# Altium schematic sheet ADL S PCH 600 SPI_PM.schdoc
size 420 x 298 mm; Symbol: Sheet-Symbol_A3; Company: 嘉立创EDA; Version: V1.0; Page Size: A3; @Project Name: 【全网首发】X86电脑主板_copy; @Page Count: 9; @Update Date: 2025-10-09; @Create Date: 2025-10-09; @Schematic Name: SCHEMATIC1_1; @Page No: 0; @Page Name: ADL S PCH 600 SPI/PM; Device: Sheet-Symbol_A3
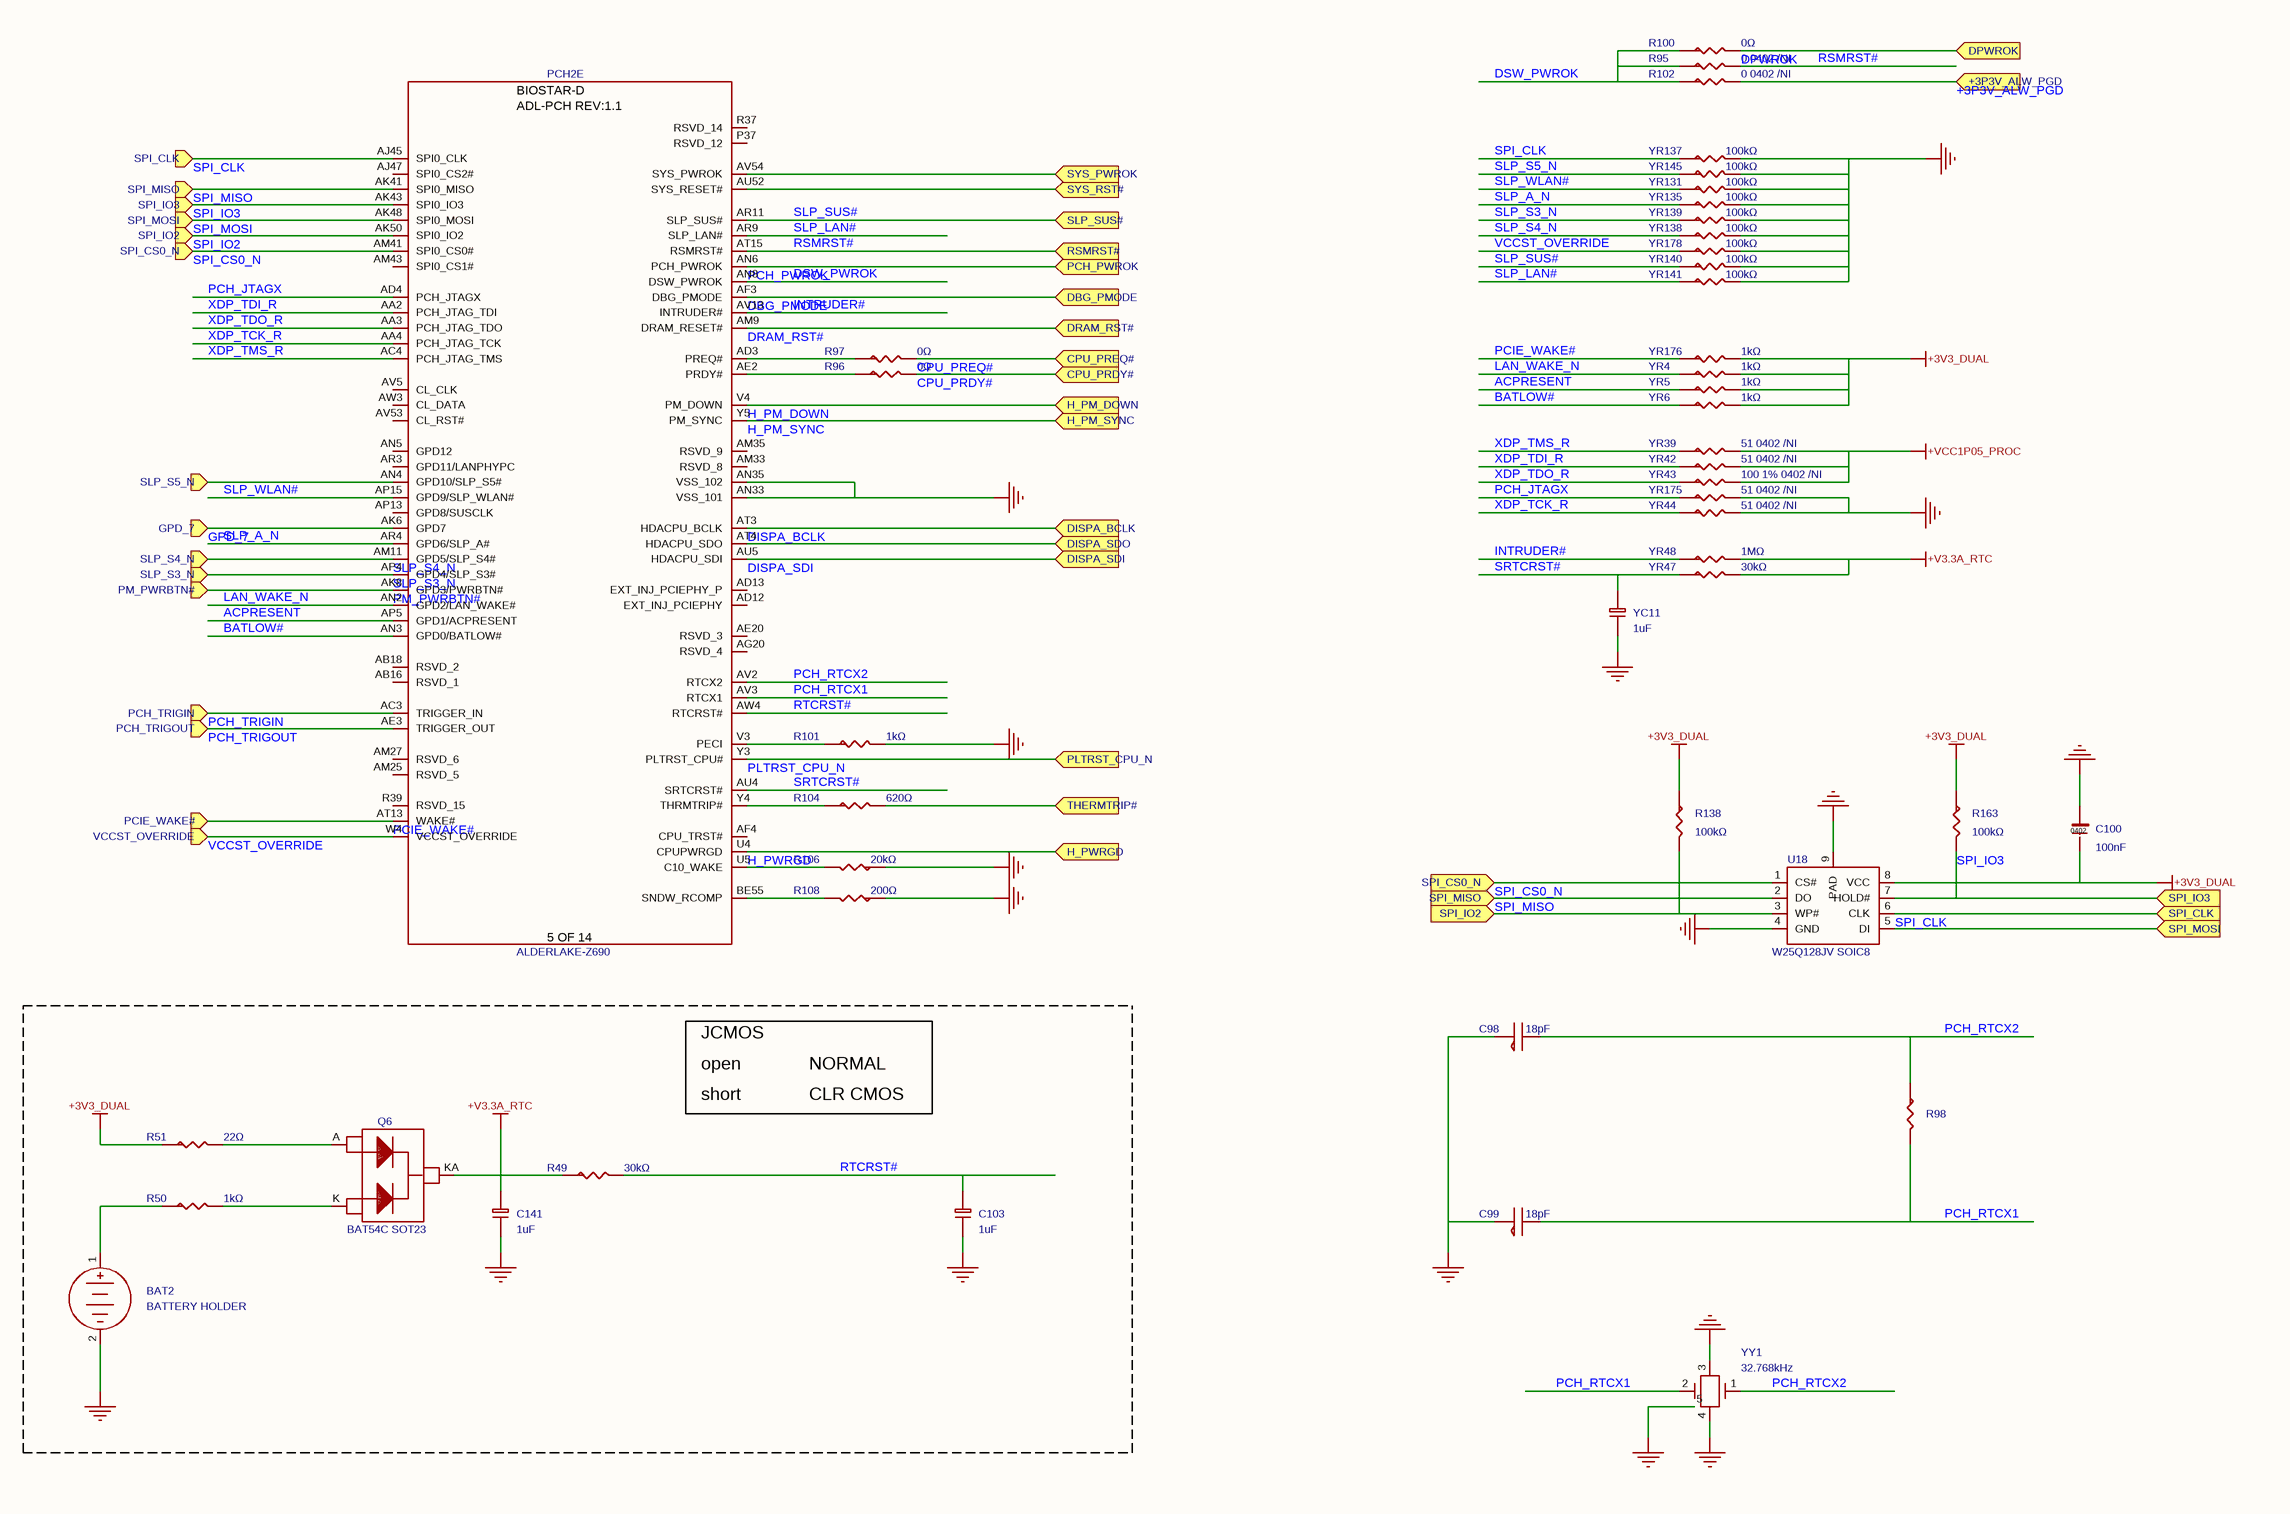
[diagram p0: ADL S PCH 600 SPI_PM.schdoc]

## Parts
BAT2  value BATTERY HOLDER  [BAT]  (hidden comment: BS-02-A1AJ010)
C98  18pF  [C0402_2]
C99  18pF  [C0402]
C100  100nF  [C0402_3]
C103  1uF  [C0402_2]
C141  1uF  [C0402_3]
PCH2  value ALDERLAKE-Z690  [BGA1045_28X25MM-ADL]  (hidden comment: ADL_S_PCH_EXT_4)  (part E of 14)
Q6  value BAT54C SOT23  [SOT23-AKAK]  (hidden comment: BAT54C)
R49  30kΩ  [R0402_2]
R50  1kΩ  [R0402]
R51  22Ω  [R0402_2]
R95  value 0 0402 /NI  [R0402_2]  (hidden comment: 42A**-F)
R96  0Ω  [R0402]
R97  0Ω  [R0402_1]
R98  0402WGF1005TCE  [R0402_2]  (value not drawn)
R100  0Ω  [R0402]
R101  1kΩ  [R0402_1]
R102  value 0 0402 /NI  [R0402_3]  (hidden comment: 42A**-F)
R104  620Ω  [R0402]
R106  20kΩ  [R0402_2]
R108  200Ω  [R0402_1]
R138  100kΩ  [R0402_1]
R163  100kΩ  [R0402]
U18  value W25Q128JV SOIC8  [WSON8-8X6MM-9P]  (hidden comment: W25Q128JVSIQ)
YC11  1uF  [C0402_2]
YR4  1kΩ  [R0402_1]
YR5  1kΩ  [R0402_1]
YR6  1kΩ  [R0402_1]
YR39  value 51 0402 /NI  [R0402]  (hidden comment: R-0603)
YR42  value 51 0402 /NI  [R0402]  (hidden comment: R-0603)
YR43  value 100 1% 0402 /NI  [R0402]  (hidden comment: R-0603)
YR44  value 51 0402 /NI  [R0402]  (hidden comment: R-0603)
YR47  30kΩ  [R0402]
YR48  1MΩ  [R0402]
YR131  100kΩ  [R0402]
YR135  100kΩ  [R0402]
YR137  100kΩ  [R0402_3]
YR138  100kΩ  [R0402_2]
YR139  100kΩ  [R0402]
YR140  100kΩ  [R0402_2]
YR141  100kΩ  [R0402_2]
YR145  100kΩ  [R0402]
YR175  value 51 0402 /NI  [R0402]  (hidden comment: R-0603)
YR176  1kΩ  [R0402_1]
YR178  100kΩ  [R0402]
YY1  32.768kHz  [XTAL_CYLINDER_DH]

## Ports
+3P3V_ALW_PGD (in), CPU_PRDY# (in), CPU_PREQ# (in), DBG_PMODE (in), DISPA_BCLK (in), DISPA_SDI (in), DISPA_SDO (in), DPWROK (in), DRAM_RST# (in), GPD_7 (in), H_PM_DOWN (in), H_PM_SYNC (in), H_PWRGD (in), PCH_PWROK (in), PCH_TRIGIN (in), PCH_TRIGOUT (in), PCIE_WAKE# (in), PLTRST_CPU_N (in), PM_PWRBTN# (in), RSMRST# (in), SLP_S3_N (in), SLP_S4_N (in), SLP_S5_N (in), SLP_SUS# (in), SPI_CLK (in), SPI_CS0_N (in), SPI_IO2 (in), SPI_IO3 (in), SPI_MISO (in), SPI_MOSI (in), SYS_PWROK (in), SYS_RST# (in), THERMTRIP# (in), VCCST_OVERRIDE (in)

## Nets
+3V3_DUAL: C100.2 R51.1 R138.1 R163.1 U18.8(VCC) YR4.2 YR5.2 YR6.2 YR176.2
+V3.3A_RTC: C141.1 Q6.KA R49.1 YR47.2 YR48.2
+VCC1P05_PROC: YR39.2 YR42.2 YR43.2
GND: BAT2.2(-) C98.1 C99.1 C100.1 C103.2 C141.2 PCH2.AN33(VSS_101) PCH2.AN35(VSS_102) R101.2 R106.1 R108.1 U18.4(GND) U18.9(PAD) YC11.2 YR44.2 YR131.2 YR135.2 YR137.2 YR138.2 YR139.2 YR140.2 YR141.2 YR145.2 YR175.2 YR178.2 YY1.3 YY1.4 YY1.5
+3P3V_ALW_PGD: R102.2 ; port +3P3V_ALW_PGD
ACPRESENT: PCH2.AP5(GPD1/ACPRESENT) YR5.1
BATLOW#: PCH2.AN3(GPD0/BATLOW#) YR6.1
CPU_PRDY#: R96.2 ; port CPU_PRDY#
CPU_PREQ#: R97.2 ; port CPU_PREQ#
DBG_PMODE: PCH2.AF3(DBG_PMODE) ; port DBG_PMODE
DISPA_BCLK: PCH2.AT3(HDACPU_BCLK) ; port DISPA_BCLK
DISPA_SDI: PCH2.AU5(HDACPU_SDI) ; port DISPA_SDI
DISPA_SDO: PCH2.AT4(HDACPU_SDO) ; port DISPA_SDO
DPWROK: R100.2 ; port DPWROK
DRAM_RST#: PCH2.AM9(DRAM_RESET#) ; port DRAM_RST#
DSW_PWROK: PCH2.AN8(DSW_PWROK) R95.1 R100.1 R102.1
GPD_7: PCH2.AK6(GPD7) ; port GPD_7
H_PM_DOWN: PCH2.V4(PM_DOWN) ; port H_PM_DOWN
H_PM_SYNC: PCH2.Y5(PM_SYNC) ; port H_PM_SYNC
H_PWRGD: PCH2.U4(CPUPWRGD) ; port H_PWRGD
INTRUDER#: PCH2.AV13(INTRUDER#) YR48.1
LAN_WAKE_N: PCH2.AN2(GPD2/LAN_WAKE#) YR4.1
PCH_JTAGX: PCH2.AD4(PCH_JTAGX) YR175.1
PCH_PWROK: PCH2.AN6(PCH_PWROK) ; port PCH_PWROK
PCH_RTCX1: C99.2 PCH2.AV3(RTCX1) R98.2 YY1.2
PCH_RTCX2: C98.2 PCH2.AV2(RTCX2) R98.1 YY1.1
PCH_TRIGIN: PCH2.AC3(TRIGGER_IN) ; port PCH_TRIGIN
PCH_TRIGOUT: PCH2.AE3(TRIGGER_OUT) ; port PCH_TRIGOUT
PCIE_WAKE#: PCH2.AT13(WAKE#) YR176.1 ; port PCIE_WAKE#
PLTRST_CPU_N: PCH2.Y3(PLTRST_CPU#) ; port PLTRST_CPU_N
PM_PWRBTN#: PCH2.AK8(GPD3/PWRBTN#) ; port PM_PWRBTN#
RSMRST#: PCH2.AT15(RSMRST#) R95.2 ; port RSMRST#
RTCRST#: C103.1 PCH2.AW4(RTCRST#) R49.2
SLP_A_N: PCH2.AR4(GPD6/SLP_A#) YR135.1
SLP_LAN#: PCH2.AR9(SLP_LAN#) YR141.1
SLP_S3_N: PCH2.AP4(GPD4/SLP_S3#) YR139.1 ; port SLP_S3_N
SLP_S4_N: PCH2.AM11(GPD5/SLP_S4#) YR138.1 ; port SLP_S4_N
SLP_S5_N: PCH2.AN4(GPD10/SLP_S5#) ; port SLP_S5_N
SLP_S5_N: YR145.1  [a separate net that carries the same name]
SLP_SUS#: PCH2.AR11(SLP_SUS#) YR140.1 ; port SLP_SUS#
SLP_WLAN#: PCH2.AP15(GPD9/SLP_WLAN#) YR131.1
SPI_CLK: PCH2.AJ45(SPI0_CLK) U18.6(CLK) YR137.1 ; port SPI_CLK
SPI_CS0_N: PCH2.AM41(SPI0_CS0#) U18.1(CS#) ; port SPI_CS0_N
SPI_IO2: PCH2.AK50(SPI0_IO2) R138.2 U18.3(WP#) ; port SPI_IO2
SPI_IO3: PCH2.AK43(SPI0_IO3) R163.2 U18.7(HOLD#) ; port SPI_IO3
SPI_MISO: PCH2.AK41(SPI0_MISO) U18.2(DO) ; port SPI_MISO
SPI_MOSI: PCH2.AK48(SPI0_MOSI) U18.5(DI) ; port SPI_MOSI
SRTCRST#: PCH2.AU4(SRTCRST#) YC11.1 YR47.1
SYS_PWROK: PCH2.AV54(SYS_PWROK) ; port SYS_PWROK
SYS_RST#: PCH2.AU52(SYS_RESET#) ; port SYS_RST#
THERMTRIP#: R104.2 ; port THERMTRIP#
VCCST_OVERRIDE: PCH2.W4(VCCST_OVERRIDE) YR178.1 ; port VCCST_OVERRIDE
XDP_TCK_R: PCH2.AA4(PCH_JTAG_TCK) YR44.1
XDP_TDI_R: PCH2.AA2(PCH_JTAG_TDI) YR42.1
XDP_TDO_R: PCH2.AA3(PCH_JTAG_TDO) YR43.1
XDP_TMS_R: PCH2.AC4(PCH_JTAG_TMS) YR39.1
NetBAT2_1: BAT2.1(+) R50.1
NetPCH2_AD3: PCH2.AD3(PREQ#) R97.1
NetPCH2_AE2: PCH2.AE2(PRDY#) R96.1
NetPCH2_BE55: PCH2.BE55(SNDW_RCOMP) R108.2
NetPCH2_U5: PCH2.U5(C10_WAKE) R106.2
NetPCH2_V3: PCH2.V3(PECI) R101.1
NetPCH2_Y4: PCH2.Y4(THRMTRIP#) R104.1
NetQ6_A: Q6.A R51.2
NetQ6_K: Q6.K R50.2

Not connected (* = marked no-connect by the designer): PCH2 AB16(RSVD_1) AB18(RSVD_2) AD12(EXT_INJ_PCIEPHY) AD13(EXT_INJ_PCIEPHY_P) AE20(RSVD_3) AF4(CPU_TRST#) AG20(RSVD_4) AJ47(SPI0_CS2#) AM25(RSVD_5) AM27(RSVD_6) AM33(RSVD_8) AM35(RSVD_9) AM43(SPI0_CS1#) AN5(GPD12) AP13(GPD8/SUSCLK) AR3(GPD11/LANPHYPC) AV5(CL_CLK) AV53(CL_RST#) AW3(CL_DATA) P37(RSVD_12) R37(RSVD_14) R39(RSVD_15)

## Notes on the sheet
- JCMOS
- short
- open
- CLR CMOS
- NORMAL
- 更新日期
- 2025-10-09
- 原理图
- 图页
- SCHEMATIC1_1
- ADL S PCH 600 SPI/PM
- 创建日期
- 物料编码
- 审阅
- 绘制
- 【全网首发】X86电脑主板_copy
- 版本
- V1.0
- 尺寸
- A3
- 页
- 0
- 嘉立创EDA
- 共
- 9
- (in symbol ADL_S_PCH_EXT_4, part E) BIOSTAR-D; ADL-PCH REV:1.1; 5 OF 14

## Library data of the parts
BAT2 = BS-02-A1AJ010: 连接器类型:电池底座;适用电池规格:CR2032;工作温度范围:-25℃~+85℃;; Manufacturer: MYOUNG(美阳); Symbol: BATTERY_2; AddInBom: yes; ModelId: 45816e8fa50b4d3ea70b2401b82a928f; ModelName: BAT-TH_BS-02-A1AJ010; ModelTransform: 963.726,869.93873,0,0,0,0,-33.504,0,-118.11; Connector Type: 电池底座; Battery Type: CR2032; Device: BS-02-A1AJ010; LCSC Part Name: 电池底座 适用电池:CR2032; SupplierPart: C5239862; ManufacturerPart: BS-02-A1AJ010; Supplier Footprint: 插件; JLCPCB Part Class: Extended Part; Datasheet: https://atta.szlcsc.com/upload/public/pdf/source/20221102/8F00F2B23A2A3C447A59C327BBA6C743.pdf; Supplier: LCSC; ConvertToPcb: yes; FootprintName: BAT; Operating Temperature Range: -25℃~+85℃
C98 C99 = CC0402FRNPO9BN180: 容值:18pF;精度:±1%;额定电压:50V;材质(温度系数):NP0;; Manufacturer: YAGEO(国巨); Symbol: CAPNP; AddInBom: yes; ModelId: 36a51122f27c49738f86b3bfa98863e0; ModelName: C0402_L1.0-W0.5-H0.5; ModelTransform: 39.37,19.685,0,0,0,0,0,0,0; Tolerance: ±1%; Voltage Rated: 50V; Temperature Coefficient: NP0; Device: CC0402FRNPO9BN180; Value: 18pF; LCSC Part Name: 18pF ±1% 50V; SupplierPart: C541431; ManufacturerPart: CC0402FRNPO9BN180; Supplier Footprint: 0402; JLCPCB Part Class: Extended Part; Datasheet: https://atta.szlcsc.com/upload/public/pdf/source/20200615/C541431_FAFCAA54FB89671184DDCAE44D787100.pdf; Supplier: LCSC; ConvertToPcb: yes
  C98: FootprintName: C0402_2
  C99: FootprintName: C0402
C100 = CL05B104KO5NNNC: 容值:100nF;精度:±10%;额定电压:16V;材质(温度系数):X7R;; Manufacturer: SAMSUNG(三星); Symbol: C0402; ModelId: 36a51122f27c49738f86b3bfa98863e0; Tolerance: ±10%; AddInBom: yes; Voltage Rated: 16V; ModelName: C0402_L1.0-W0.5-H0.5; ModelTransform: 39.37,19.685,0,0,0,0,0,0,0; Temperature Coefficient: X7R; Device: CL05B104KO5NNNC; Value: 100nF; Supplier: LCSC; Datasheet: https://atta.szlcsc.com/upload/public/pdf/source/20160103/1457707674891.pdf; FootprintName: C0402_3; SupplierPart: C1525; ConvertToPcb: yes; LCSC Part Name: 100nF ±10% 16V; JLCPCB Part Class: Basic Part; ManufacturerPart: CL05B104KO5NNNC; Supplier Footprint: 0402
C103 C141 YC11 = CL05A105KA5NQNC: 容值:1uF;精度:±10%;额定电压:25V;材质(温度系数):X5R;; Manufacturer: SAMSUNG(三星); Symbol: CAP; PCB Footprint: C0402; Tolerance: ±10%; ModelId: 36a51122f27c49738f86b3bfa98863e0; AddInBom: yes; Voltage Rated: 25V; ModelName: C0402_L1.0-W0.5-H0.5; ModelTransform: 39.37,19.685,0,0,0,0,0,0,0; Temperature Coefficient: X5R; Device: CL05A105KA5NQNC; Value: 1uF; Supplier: LCSC; Datasheet: https://atta.szlcsc.com/upload/public/pdf/source/20160103/1457707735223.pdf; SupplierPart: C52923; ConvertToPcb: yes; LCSC Part Name: 1uF ±10% 25V; JLCPCB Part Class: Basic Part; ManufacturerPart: CL05A105KA5NQNC; Supplier Footprint: 0402
  C103 YC11: FootprintName: C0402_2
  C141: FootprintName: C0402_3
PCH2 = ADL_S_PCH_EXT_4: AddInBom: yes; Device: ADL_S_PCH_EXT_4; Symbol: ADL_S_PCH_EXT_4; FootprintName: BGA1045_28X25MM-ADL; ConvertToPcb: yes
Q6 = BAT54C_C2135: 二极管配置:-;直流反向耐压(Vr):30V;平均整流电流(Io):200mA;正向压降(Vf):1V@100mA;; Manufacturer: CJ(江苏长电/长晶); Symbol: BAT54C SOT-23_0; ModelId: 89cb27a44ab2466697082bb9fd73a7d0; AddInBom: yes; ModelName: SOT-23-3L_L2.9-W1.6-H1.1-LS2.8-P0.95; ModelTransform: 110.236,114.173,0,180,0,0,-0.005,0.0005,0; Reverse Voltage (Vr): 30V; Average Rectified Current (Io): 200mA; Device: BAT54C_C2135; Supplier: LCSC; Datasheet: https://atta.szlcsc.com/upload/public/pdf/source/20140809/1457707208935.pdf; FootprintName: SOT23-AKAK; SupplierPart: C2135; ConvertToPcb: yes; LCSC Part Name: 30V 200mA 1V@100mA; JLCPCB Part Class: Extended Part; ManufacturerPart: BAT54C; Supplier Footprint: SOT-23; Diode Configuration: -; Forward Voltage (Vf@If): 1V@100mA; Reverse Leakage Current (Ir): -
R49 YR47 = RC0402FR-0730KL: 电阻类型:厚膜电阻;阻值:30kΩ;精度:±1%;功率:62.5mW;; Manufacturer: YAGEO(国巨); Symbol: R-0603; ModelId: 671aefced39d4c318694bba8bd8efd39; Tolerance: ±1%; AddInBom: yes; Power(Watts): 62.5mW; ModelName: R0402_L1.0-W0.5-H0.5; ModelTransform: 39.37,19.685,0,0,0,0,0,0.0005,0; Overload Voltage (Max): 50V; Temperature Coefficient: ±100ppm/℃; Device: RC0402FR-0730KL; Value: 30kΩ; Type: 厚膜电阻; Supplier: LCSC; Datasheet: https://atta.szlcsc.com/upload/public/pdf/source/20171107/C138008_15100516356731096935.pdf; SupplierPart: C138008; ConvertToPcb: yes; LCSC Part Name: 30kΩ ±1% 62.5mW; JLCPCB Part Class: Extended Part; ManufacturerPart: RC0402FR-0730KL; Supplier Footprint: 0402; Operating Temperature Range: -55℃~+155℃
  R49: FootprintName: R0402_2
  YR47: FootprintName: R0402
R50 YR4-YR6 YR176 = 0402WGF1001TCE: 电阻类型:厚膜电阻;阻值:1kΩ;精度:±1%;功率:62.5mW;; Manufacturer: UNI-ROYAL(厚声); Symbol: R-0603; ModelId: 671aefced39d4c318694bba8bd8efd39; Tolerance: ±1%; AddInBom: yes; Power(Watts): 62.5mW; ModelName: R0402_L1.0-W0.5-H0.5; ModelTransform: 39.37,19.685,0,0,0,0,0,0.0005,0; Overload Voltage (Max): 50V; Temperature Coefficient: ±100ppm/℃; Device: 0402WGF1001TCE; Value: 1kΩ; Type: 厚膜电阻; Supplier: LCSC; Datasheet: https://atta.szlcsc.com/upload/public/pdf/source/20200306/C422600_1E6D84923E4A46A82E41ADD87F860B5C.pdf; SupplierPart: C11702; ConvertToPcb: yes; LCSC Part Name: 1kΩ ±1% 62.5mW; JLCPCB Part Class: Basic Part; ManufacturerPart: 0402WGF1001TCE; Supplier Footprint: 0402; Operating Temperature Range: -55℃~+155℃
  R50: FootprintName: R0402
  YR4-YR6 YR176: FootprintName: R0402_1
R51 = 0402WGF220JTCE: 电阻类型:厚膜电阻;阻值:22Ω;精度:±1%;功率:62.5mW;温度系数:±100ppm/℃;; Manufacturer: UNI-ROYAL(厚声); Symbol: R-0603; ModelId: 671aefced39d4c318694bba8bd8efd39; Tolerance: ±1%; AddInBom: yes; Power(Watts): 62.5mW; ModelName: R0402_L1.0-W0.5-H0.5; ModelTransform: 39.37,19.685,0,0,0,0,0,0.0005,0; Overload Voltage (Max): 50V; Device: 0402WGF220JTCE; Value: 22Ω; Type: 厚膜电阻; Supplier: LCSC; Datasheet: https://atta.szlcsc.com/upload/public/pdf/source/20200306/C422600_1E6D84923E4A46A82E41ADD87F860B5C.pdf; FootprintName: R0402_2; SupplierPart: C25092; ConvertToPcb: yes; LCSC Part Name: 厚膜电阻 22Ω ±1% 62.5mW; JLCPCB Part Class: Basic Part; ManufacturerPart: 0402WGF220JTCE; Supplier Footprint: 0402; Temperature Coefficient: ±100ppm/℃; Operating Temperature Range: -55℃~+155℃
R95 = 42A**-F_1: Manufacturer: UNI-ROYAL(厚声); Manufacturer Part: 0402WGF0000TCE; PCB Footprint: R0402; 3D Model: 671aefced39d4c318694bba8bd8efd39; 3D Model Transform: 39.37,19.685,0,0,0,0,0,0.0005,0; Tolerance: ±1%; Power(Watts): 62.5mW; Overload Voltage (Max): 50V; Temperature Coefficient: ±800ppm/℃; AddInBom: yes; Device: 42A**-F_1; Symbol: 42A**-F; LCSC Part Name: 0Ω ±1% 62.5mW 厚膜电阻; Supplier Part: C17168; Supplier Footprint: 0402; JLCPCB Part Class: Basic Part; Datasheet: https://atta.szlcsc.com/upload/public/pdf/source/20200306/C422600_1E6D84923E4A46A82E41ADD87F860B5C.pdf; Supplier: LCSC; Type: 厚膜电阻; Operating Temperature Range: -55℃~+155℃; FootprintName: R0402_2; ConvertToPcb: yes
R96 R100 = 0402WGF0000TCE: 电阻类型:厚膜电阻;阻值:0Ω;精度:±1%;功率:62.5mW;; Manufacturer: UNI-ROYAL(厚声); Symbol: 42A**-F; ModelId: 671aefced39d4c318694bba8bd8efd39; Tolerance: ±1%; AddInBom: yes; Power(Watts): 62.5mW; ModelName: R0402_L1.0-W0.5-H0.5; ModelTransform: 39.37,19.685,0,0,0,0,0,0.0005,0; Overload Voltage (Max): 50V; Temperature Coefficient: ±800ppm/℃; Device: 0402WGF0000TCE; PCB Footprint: R0402; Value: 0Ω; Type: 厚膜电阻; Supplier: LCSC; Datasheet: https://atta.szlcsc.com/upload/public/pdf/source/20200306/C422600_1E6D84923E4A46A82E41ADD87F860B5C.pdf; FootprintName: R0402; SupplierPart: C17168; ConvertToPcb: yes; LCSC Part Name: 0Ω ±1% 62.5mW; JLCPCB Part Class: Basic Part; ManufacturerPart: 0402WGF0000TCE; Supplier Footprint: 0402; Operating Temperature Range: -55℃~+155℃
R97 = 0402WGF0000TCE: 电阻类型:厚膜电阻;阻值:0Ω;精度:±1%;功率:62.5mW;; Manufacturer: UNI-ROYAL(厚声); Symbol: 42A**-F; PCB Footprint: R0402; ModelId: 671aefced39d4c318694bba8bd8efd39; Tolerance: ±1%; AddInBom: yes; Power(Watts): 62.5mW; ModelName: R0402_L1.0-W0.5-H0.5; ModelTransform: 39.37,19.685,0,0,0,0,0,0.0005,0; Overload Voltage (Max): 50V; Temperature Coefficient: ±800ppm/℃; Device: 0402WGF0000TCE; Value: 0Ω; Type: 厚膜电阻; Supplier: LCSC; Datasheet: https://atta.szlcsc.com/upload/public/pdf/source/20200306/C422600_1E6D84923E4A46A82E41ADD87F860B5C.pdf; FootprintName: R0402_1; SupplierPart: C17168; ConvertToPcb: yes; LCSC Part Name: 0Ω ±1% 62.5mW; JLCPCB Part Class: Basic Part; ManufacturerPart: 0402WGF0000TCE; Supplier Footprint: 0402; Operating Temperature Range: -55℃~+155℃
R98 = 0402WGF1005TCE: Manufacturer: UNI-ROYAL(厚声); Symbol: R_2; ModelId: 671aefced39d4c318694bba8bd8efd39; AddInBom: yes; ModelName: R0402_L1.0-W0.5-H0.5; ModelTransform: 39.37,19.685,0,0,0,0,0,0.0005,0; Device: 0402WGF1005TCE; Supplier: LCSC; Datasheet: https://atta.szlcsc.com/upload/public/pdf/source/20170920/C26082_1505895182245981068.pdf; FootprintName: R0402_2; SupplierPart: C26082; ConvertToPcb: yes; LCSC Part Name: 10MΩ(1005) ±1% 编带; JLCPCB Part Class: Basic Part; ManufacturerPart: 0402WGF1005TCE; Supplier Footprint: 0402
R101 = 0402WGF1001TCE: 电阻类型:厚膜电阻;阻值:1kΩ;精度:±1%;功率:62.5mW;; Manufacturer: UNI-ROYAL(厚声); Symbol: 42A**-F; PCB Footprint: R0402; ModelId: 671aefced39d4c318694bba8bd8efd39; Tolerance: ±1%; AddInBom: yes; Power(Watts): 62.5mW; ModelName: R0402_L1.0-W0.5-H0.5; ModelTransform: 39.37,19.685,0,0,0,0,0,0.0005,0; Overload Voltage (Max): 50V; Temperature Coefficient: ±100ppm/℃; Device: 0402WGF1001TCE; Value: 1kΩ; Type: 厚膜电阻; Supplier: LCSC; Datasheet: https://atta.szlcsc.com/upload/public/pdf/source/20200306/C422600_1E6D84923E4A46A82E41ADD87F860B5C.pdf; FootprintName: R0402_1; SupplierPart: C11702; ConvertToPcb: yes; LCSC Part Name: 1kΩ ±1% 62.5mW; JLCPCB Part Class: Basic Part; ManufacturerPart: 0402WGF1001TCE; Supplier Footprint: 0402; Operating Temperature Range: -55℃~+155℃
R102 = 42A**-F: Manufacturer: UNI-ROYAL(厚声); Manufacturer Part: 0402WGF0000TCE; PCB Footprint: R0402; 3D Model: 671aefced39d4c318694bba8bd8efd39; 3D Model Transform: 39.37,19.685,0,0,0,0,0,0.0005,0; Tolerance: ±1%; Power(Watts): 62.5mW; Overload Voltage (Max): 50V; Temperature Coefficient: ±800ppm/℃; AddInBom: yes; Device: 42A**-F; Symbol: 42A**-F; LCSC Part Name: 0Ω ±1% 62.5mW 厚膜电阻; Supplier Part: C17168; Supplier Footprint: 0402; JLCPCB Part Class: Basic Part; Datasheet: https://atta.szlcsc.com/upload/public/pdf/source/20200306/C422600_1E6D84923E4A46A82E41ADD87F860B5C.pdf; Supplier: LCSC; Type: 厚膜电阻; Operating Temperature Range: -55℃~+155℃; FootprintName: R0402_3; ConvertToPcb: yes
R104 = RC0402FR-07620RL: 电阻类型:厚膜电阻;阻值:620Ω;精度:±1%;功率:62.5mW;最大工作电压:50V;温度系数:±100ppm/℃;; Manufacturer: YAGEO(国巨); Symbol: 42A**-F; AddInBom: yes; ModelId: 671aefced39d4c318694bba8bd8efd39; ModelName: R0402_L1.0-W0.5-H0.5; ModelTransform: 39.37,19.685,0,0,0,0,0,0.0005,0; Tolerance: ±1%; Power(Watts): 62.5mW; Overload Voltage (Max): 50V; Device: RC0402FR-07620RL; PCB Footprint: R0402; Value: 620Ω; LCSC Part Name: 厚膜电阻 620Ω ±1% 62.5mW; SupplierPart: C137951; ManufacturerPart: RC0402FR-07620RL; Supplier Footprint: 0402; JLCPCB Part Class: Extended Part; Datasheet: https://atta.szlcsc.com/upload/public/pdf/source/20181009/C309620_DA5935B6E1D48212CB7A533FE518B3C2.pdf; Supplier: LCSC; ConvertToPcb: yes; FootprintName: R0402; Type: 厚膜电阻; Temperature Coefficient: ±100ppm/℃; Operating Temperature Range: -55℃~+155℃
R106 = 0402WGF2002TCE: 电阻类型:厚膜电阻;阻值:20kΩ;精度:±1%;功率:62.5mW;; Manufacturer: UNI-ROYAL(厚声); Symbol: 42A**-F; PCB Footprint: R0402; ModelId: 671aefced39d4c318694bba8bd8efd39; Tolerance: ±1%; AddInBom: yes; Power(Watts): 62.5mW; ModelName: R0402_L1.0-W0.5-H0.5; ModelTransform: 39.37,19.685,0,0,0,0,0,0.0005,0; Overload Voltage (Max): 50V; Temperature Coefficient: ±100ppm/℃; Device: 0402WGF2002TCE; Value: 20kΩ; Type: 厚膜电阻; Supplier: LCSC; Datasheet: https://atta.szlcsc.com/upload/public/pdf/source/20200306/C422600_1E6D84923E4A46A82E41ADD87F860B5C.pdf; FootprintName: R0402_2; SupplierPart: C25765; ConvertToPcb: yes; LCSC Part Name: 20kΩ ±1% 62.5mW; JLCPCB Part Class: Basic Part; ManufacturerPart: 0402WGF2002TCE; Supplier Footprint: 0402; Operating Temperature Range: -55℃~+155℃
R108 = 0402WGF2000TCE: 电阻类型:厚膜电阻;阻值:200Ω;精度:±1%;功率:62.5mW;; Manufacturer: UNI-ROYAL(厚声); Symbol: 42A**-F; PCB Footprint: R0402; ModelId: 671aefced39d4c318694bba8bd8efd39; Tolerance: ±1%; AddInBom: yes; Power(Watts): 62.5mW; ModelName: R0402_L1.0-W0.5-H0.5; ModelTransform: 39.37,19.685,0,0,0,0,0,0.0005,0; Overload Voltage (Max): 50V; Temperature Coefficient: ±100ppm/℃; Device: 0402WGF2000TCE; Value: 200Ω; Type: 厚膜电阻; Supplier: LCSC; Datasheet: https://atta.szlcsc.com/upload/public/pdf/source/20200306/C422600_1E6D84923E4A46A82E41ADD87F860B5C.pdf; FootprintName: R0402_1; SupplierPart: C25087; ConvertToPcb: yes; LCSC Part Name: 200Ω ±1% 62.5mW; JLCPCB Part Class: Basic Part; ManufacturerPart: 0402WGF2000TCE; Supplier Footprint: 0402; Operating Temperature Range: -55℃~+155℃
R138 R163 = 0402WGF1003TCE: 电阻类型:厚膜电阻;阻值:100kΩ;精度:±1%;功率:62.5mW;; Manufacturer: UNI-ROYAL(厚声); Symbol: R; ModelId: 671aefced39d4c318694bba8bd8efd39; Tolerance: ±1%; AddInBom: yes; Power(Watts): 62.5mW; ModelName: R0402_L1.0-W0.5-H0.5; ModelTransform: 39.37,19.685,0,0,0,0,0,0.0005,0; Overload Voltage (Max): 50V; Temperature Coefficient: ±100ppm/℃; Device: 0402WGF1003TCE; Value: 100kΩ; Type: 厚膜电阻; Supplier: LCSC; Datasheet: https://atta.szlcsc.com/upload/public/pdf/source/20200306/C422600_1E6D84923E4A46A82E41ADD87F860B5C.pdf; SupplierPart: C25741; ConvertToPcb: yes; LCSC Part Name: 100kΩ ±1% 62.5mW; JLCPCB Part Class: Basic Part; ManufacturerPart: 0402WGF1003TCE; Supplier Footprint: 0402; Operating Temperature Range: -55℃~+155℃
  R138: FootprintName: R0402_1
  R163: FootprintName: R0402
U18 = W25Q128JVSIQ: 128Mbit(16MBx8bit),高速版,133MHz(266/532MHz Dual/Quad-SPI,66MB/S),比W25Q128FVSIG,W25Q128FVFIG更高速; Manufacturer: WINBOND(华邦); Symbol: SO8FLASHROM_0; ModelId: f83d990ad74f400caf5ac920b7771508; AddInBom: yes; ModelName: SOIC-8_L5.3-W5.3-H1.9-LS7.9-P1.27; ModelTransform: 208.661,311.25654,0,0,0,0,-0.0005,0.0005,0; Device: W25Q128JVSIQ; Supplier: LCSC; Datasheet: https://atta.szlcsc.com/upload/public/pdf/source/20170316/1489627409956.pdf; FootprintName: WSON8-8X6MM-9P; SupplierPart: C97521; ConvertToPcb: yes; LCSC Part Name: W25Q128JVSIQ 编带; JLCPCB Part Class: Basic Part; ManufacturerPart: W25Q128JVSIQ; Supplier Footprint: SOP-8-208mil
YR39 YR42-YR44 YR175 = R-0603_1: Check: false; AddInBom: yes; Device: R-0603_1; Symbol: R-0603; FootprintName: R0402; ConvertToPcb: yes
YR48 = 0402WGF1004TCE: 电阻类型:厚膜电阻;阻值:1MΩ;精度:±1%;功率:62.5mW;; Manufacturer: UNI-ROYAL(厚声); Symbol: R-0603; ModelId: 671aefced39d4c318694bba8bd8efd39; Tolerance: ±1%; AddInBom: yes; Power(Watts): 62.5mW; ModelName: R0402_L1.0-W0.5-H0.5; ModelTransform: 39.37,19.685,0,0,0,0,0,0.0005,0; Overload Voltage (Max): 50V; Temperature Coefficient: ±100ppm/℃; Device: 0402WGF1004TCE; Value: 1MΩ; Type: 厚膜电阻; Supplier: LCSC; Datasheet: https://atta.szlcsc.com/upload/public/pdf/source/20200306/C422600_1E6D84923E4A46A82E41ADD87F860B5C.pdf; FootprintName: R0402; SupplierPart: C26083; ConvertToPcb: yes; LCSC Part Name: 1MΩ ±1% 62.5mW; JLCPCB Part Class: Basic Part; ManufacturerPart: 0402WGF1004TCE; Supplier Footprint: 0402; Operating Temperature Range: -55℃~+155℃
YR131 YR135 YR137-YR141 YR145 YR178 = 0402WGF1003TCE: 电阻类型:厚膜电阻;阻值:100kΩ;精度:±1%;功率:62.5mW;; Manufacturer: UNI-ROYAL(厚声); Symbol: R-0603; ModelId: 671aefced39d4c318694bba8bd8efd39; Tolerance: ±1%; AddInBom: yes; Power(Watts): 62.5mW; ModelName: R0402_L1.0-W0.5-H0.5; ModelTransform: 39.37,19.685,0,0,0,0,0,0.0005,0; Overload Voltage (Max): 50V; Temperature Coefficient: ±100ppm/℃; Device: 0402WGF1003TCE; Value: 100kΩ; Type: 厚膜电阻; Supplier: LCSC; Datasheet: https://atta.szlcsc.com/upload/public/pdf/source/20200306/C422600_1E6D84923E4A46A82E41ADD87F860B5C.pdf; SupplierPart: C25741; ConvertToPcb: yes; LCSC Part Name: 100kΩ ±1% 62.5mW; JLCPCB Part Class: Basic Part; ManufacturerPart: 0402WGF1003TCE; Supplier Footprint: 0402; Operating Temperature Range: -55℃~+155℃
  YR131 YR135 YR139 YR145 YR178: FootprintName: R0402
  YR137: FootprintName: R0402_3
  YR138 YR140 YR141: FootprintName: R0402_2
YY1 = 7Q032768NW2: 晶振类型:直插晶振;频率:32.768kHz;常温频差:±20ppm;外接负载电容:12.5pF;频率稳定度(全温):±20ppm;; Manufacturer: HD(浩都频率); Symbol: CRYSTAL_2; AddInBom: yes; ModelId: ad832d30089d4b72bce6073ef883c6ab; ModelName: CRYSTAL-TH_BD3.1-L8.0-P2.00-1; ModelTransform: 344.4875,122.047,0,0,0,0,-166.338,0,-196.85; Crystal Type: 直插晶振; Normal temperature Frequency Tolerance: ±20ppm; External load capacitor: 12.5pF; Device: 7Q032768NW2; Value: 32.768kHz; JLCPCB Part Class: 扩展库; LCSC Part Name: 32.768kHz ±20ppm 12.5pF; SupplierPart: C655213; ManufacturerPart: 7Q032768NW2; Supplier Footprint: DT-38; Datasheet: https://atta.szlcsc.com/upload/public/pdf/source/20220223/B76C1D523ECD7D394DEF5362806F9B06.pdf; Supplier: LCSC; ConvertToPcb: yes; FootprintName: XTAL_CYLINDER_DH; Frequency Stability(Full temperature range): ±20ppm; Operating Temperature: -